# Altium schematic sheet MERLIN_Finger_4x4.SchDoc
size A2; SheetNumber: 1; SheetTotal: 1
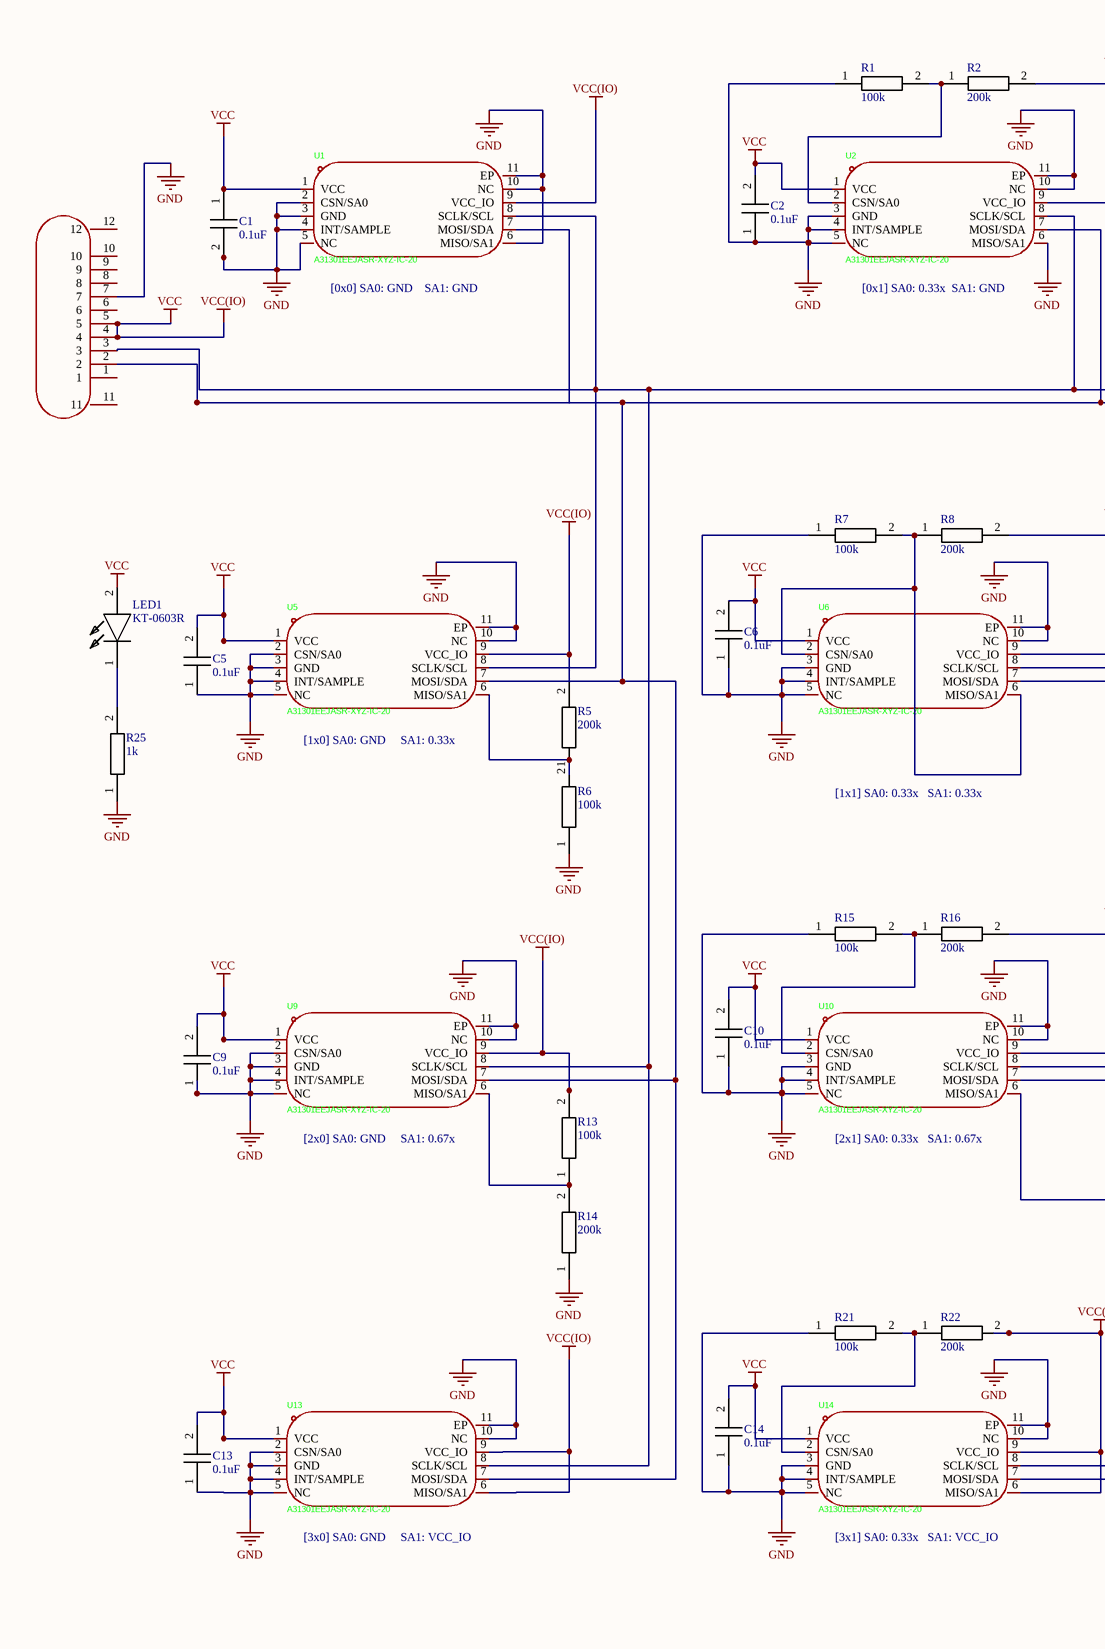
[diagram p0: MERLIN_Finger_4x4.SchDoc, left]
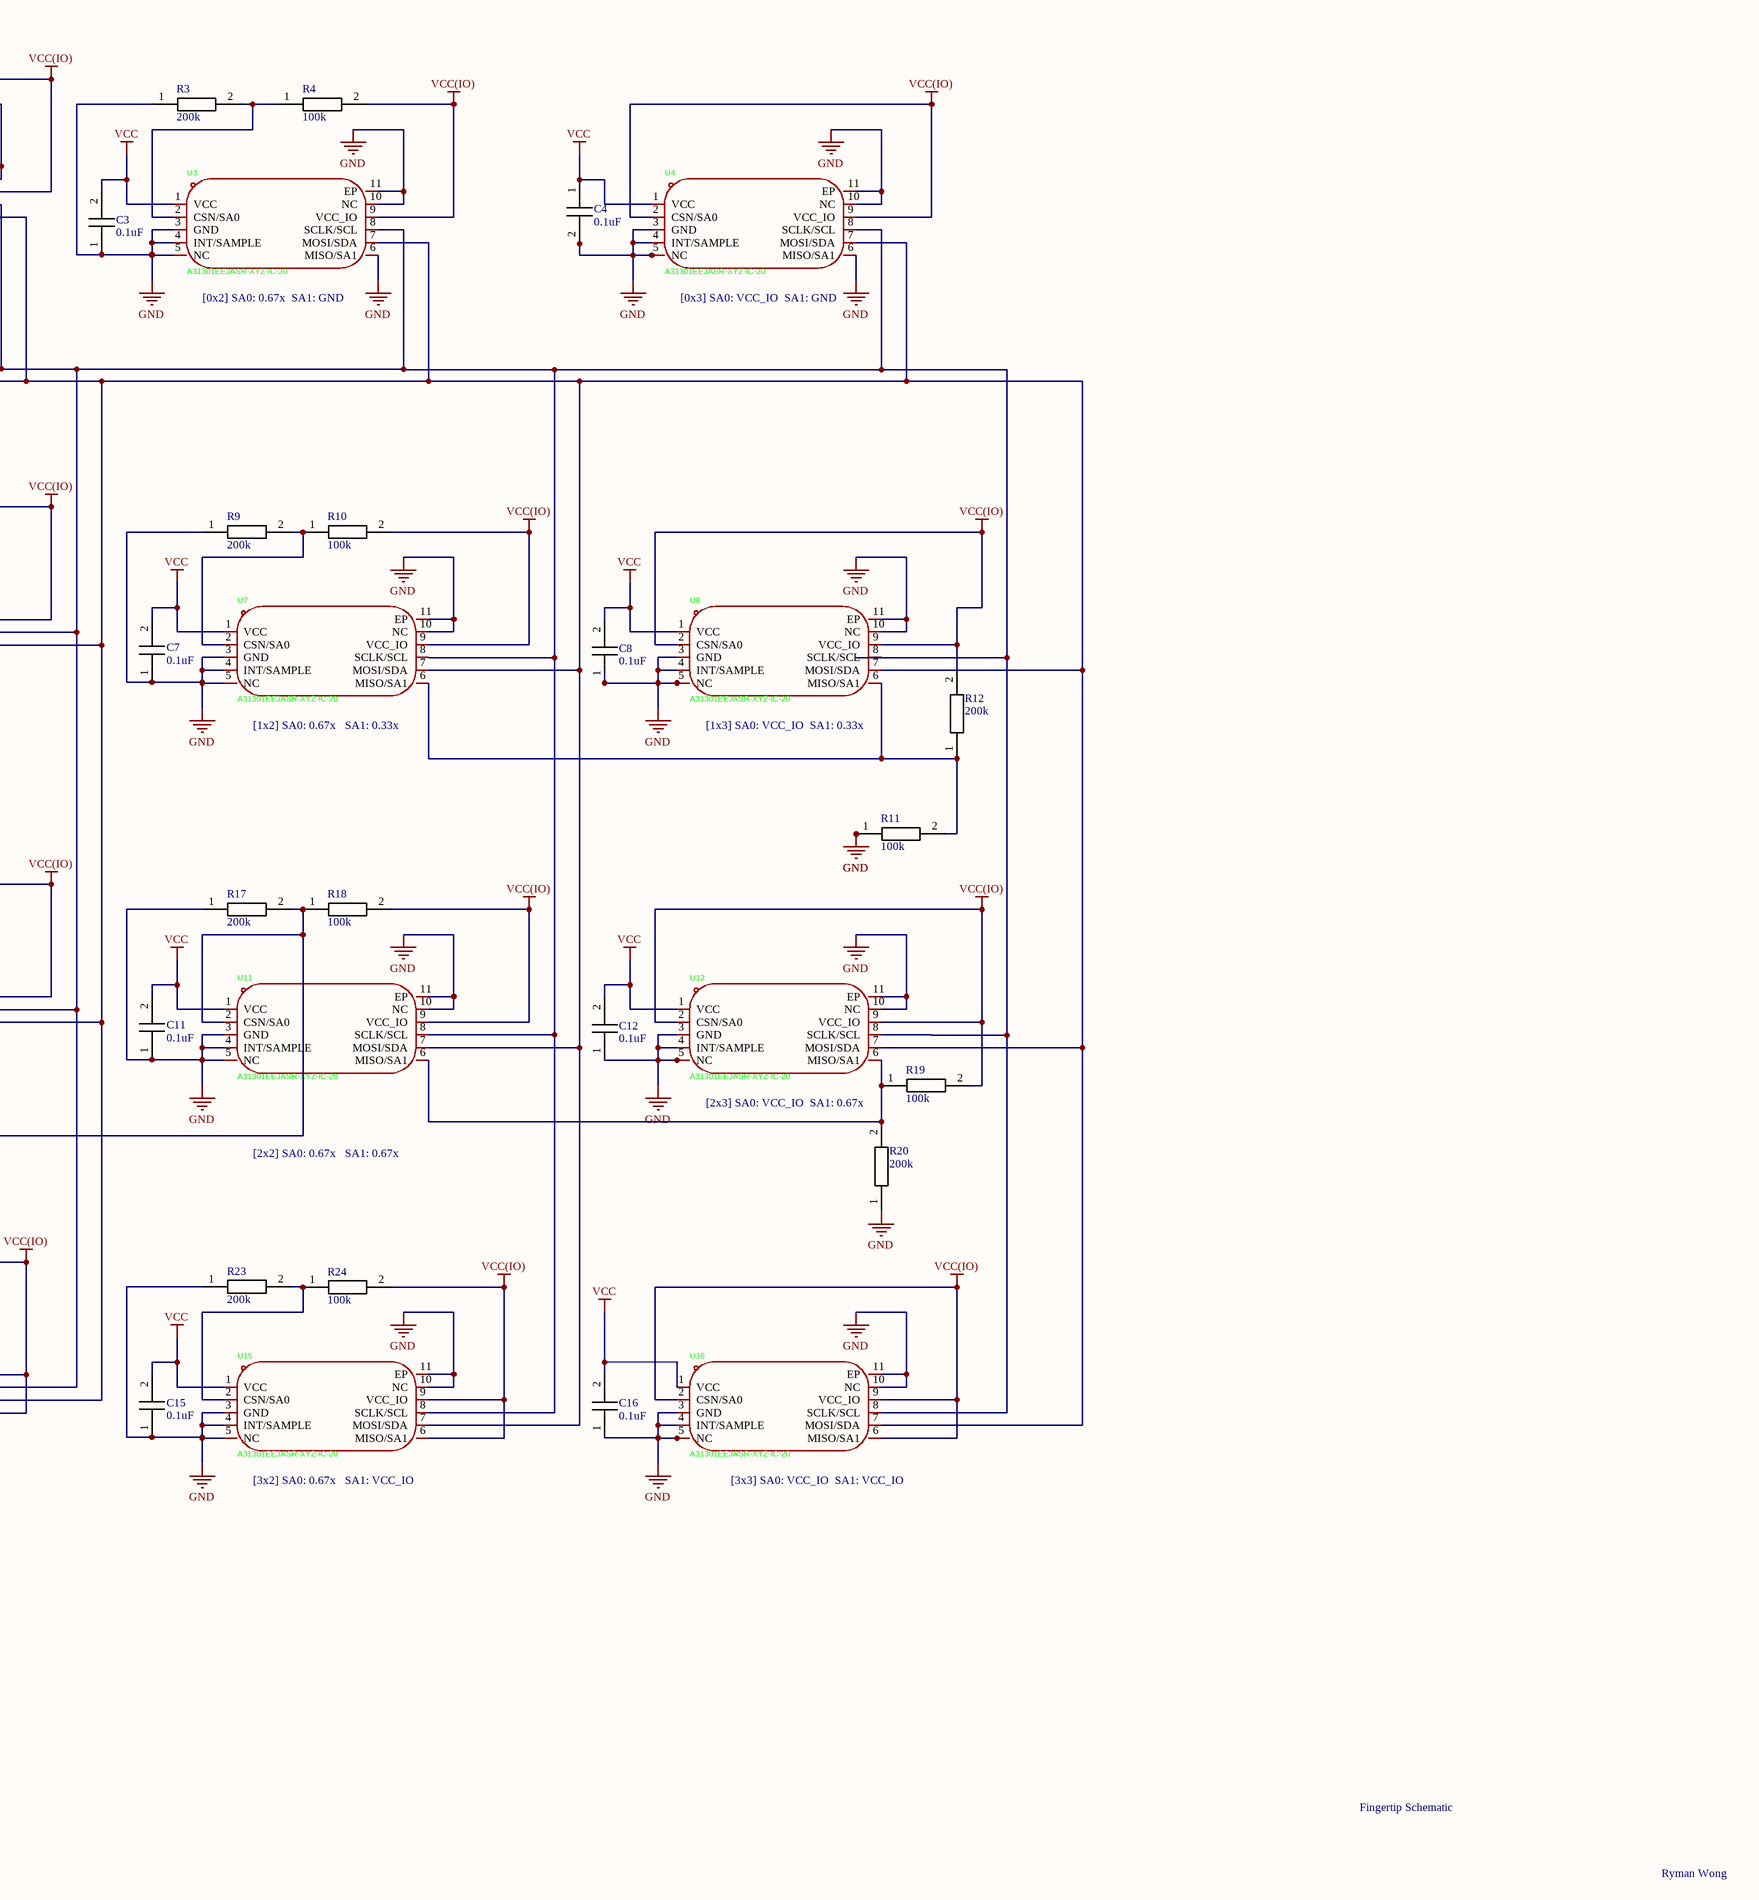
[diagram p1: MERLIN_Finger_4x4.SchDoc, right]

## Parts
C1  0.1uF  [CAPC1608X90N]
C2  0.1uF  [CAPC1608X90N]
C3  0.1uF  [CAPC1608X90N]
C4  0.1uF  [CAPC1608X90N]
C5  0.1uF  [CAPC1608X90N]
C6  0.1uF  [CAPC1608X90N]
C7  0.1uF  [CAPC1608X90N]
C8  0.1uF  [CAPC1608X90N]
C9  0.1uF  [CAPC1608X90N]
C10  0.1uF  [CAPC1608X90N]
C11  0.1uF  [CAPC1608X90N]
C12  0.1uF  [CAPC1608X90N]
C13  0.1uF  [CAPC1608X90N]
C14  0.1uF  [CAPC1608X90N]
C15  0.1uF  [CAPC1608X90N]
C16  0.1uF  [CAPC1608X90N]
FPC1  AFC07-S10ECA-00  [FPC-SMD_P0.50-10P_LCS-SJ-H2.0]  (value not drawn)
LED1  KT-0603R  [LEDC1608X70N]
R1  100k  [0603WAF3300T5E]
R2  200k  [0603WAF3300T5E]
R3  200k  [0603WAF3300T5E]
R4  100k  [0603WAF3300T5E]
R5  200k  [0603WAF3300T5E]
R6  100k  [0603WAF3300T5E]
R7  100k  [0603WAF3300T5E]
R8  200k  [0603WAF3300T5E]
R9  200k  [0603WAF3300T5E]
R10  100k  [0603WAF3300T5E]
R11  100k  [0603WAF3300T5E]
R12  200k  [0603WAF3300T5E]
R13  100k  [0603WAF3300T5E]
R14  200k  [0603WAF3300T5E]
R15  100k  [0603WAF3300T5E]
R16  200k  [0603WAF3300T5E]
R17  200k  [0603WAF3300T5E]
R18  100k  [0603WAF3300T5E]
R19  100k  [0603WAF3300T5E]
R20  200k  [0603WAF3300T5E]
R21  100k  [0603WAF3300T5E]
R22  200k  [0603WAF3300T5E]
R23  200k  [0603WAF3300T5E]
R24  100k  [0603WAF3300T5E]
R25  1k  [0603WAF3300T5E]
U1  A31301EEJASR-XYZ-IC-20  [DFN-10_L3.0-W3.0-P0.50-BL-EP2.4]
U2  A31301EEJASR-XYZ-IC-20  [DFN-10_L3.0-W3.0-P0.50-BL-EP2.4]
U3  A31301EEJASR-XYZ-IC-20  [DFN-10_L3.0-W3.0-P0.50-BL-EP2.4]
U4  A31301EEJASR-XYZ-IC-20  [DFN-10_L3.0-W3.0-P0.50-BL-EP2.4]
U5  A31301EEJASR-XYZ-IC-20  [DFN-10_L3.0-W3.0-P0.50-BL-EP2.4]
U6  A31301EEJASR-XYZ-IC-20  [DFN-10_L3.0-W3.0-P0.50-BL-EP2.4]
U7  A31301EEJASR-XYZ-IC-20  [DFN-10_L3.0-W3.0-P0.50-BL-EP2.4]
U8  A31301EEJASR-XYZ-IC-20  [DFN-10_L3.0-W3.0-P0.50-BL-EP2.4]
U9  A31301EEJASR-XYZ-IC-20  [DFN-10_L3.0-W3.0-P0.50-BL-EP2.4]
U10  A31301EEJASR-XYZ-IC-20  [DFN-10_L3.0-W3.0-P0.50-BL-EP2.4]
U11  A31301EEJASR-XYZ-IC-20  [DFN-10_L3.0-W3.0-P0.50-BL-EP2.4]
U12  A31301EEJASR-XYZ-IC-20  [DFN-10_L3.0-W3.0-P0.50-BL-EP2.4]
U13  A31301EEJASR-XYZ-IC-20  [DFN-10_L3.0-W3.0-P0.50-BL-EP2.4]
U14  A31301EEJASR-XYZ-IC-20  [DFN-10_L3.0-W3.0-P0.50-BL-EP2.4]
U15  A31301EEJASR-XYZ-IC-20  [DFN-10_L3.0-W3.0-P0.50-BL-EP2.4]
U16  A31301EEJASR-XYZ-IC-20  [DFN-10_L3.0-W3.0-P0.50-BL-EP2.4]

## Nets
GND: C1.2 C2.1 C3.1 C4.2 C5.1 C6.1 C7.1 C8.1 C9.1 C10.1 C11.1 C12.1 C13.1 C14.1 C15.1 C16.1 FPC1.7 R1.1 R3.1 R6.1 R7.1 R9.1 R11.1 R14.1 R15.1 R17.1 R20.1 R21.1 R23.1 R25.1 U1.2(CSN/SA0) U1.3(GND) U1.4(INT/SAMPLE) U1.5(NC) U1.6(MISO/SA1) U1.10(NC) U1.11(EP) U2.3(GND) U2.4(INT/SAMPLE) U2.5(NC) U2.6(MISO/SA1) U2.10(NC) U2.11(EP) U3.3(GND) U3.4(INT/SAMPLE) U3.5(NC) U3.6(MISO/SA1) U3.10(NC) U3.11(EP) U4.3(GND) U4.4(INT/SAMPLE) U4.5(NC) U4.6(MISO/SA1) U4.10(NC) U4.11(EP) U5.2(CSN/SA0) U5.3(GND) U5.4(INT/SAMPLE) U5.5(NC) U5.10(NC) U5.11(EP) U6.3(GND) U6.4(INT/SAMPLE) U6.5(NC) U6.10(NC) U6.11(EP) U7.3(GND) U7.4(INT/SAMPLE) U7.5(NC) U7.10(NC) U7.11(EP) U8.3(GND) U8.4(INT/SAMPLE) U8.5(NC) U8.10(NC) U8.11(EP) U9.2(CSN/SA0) U9.3(GND) U9.4(INT/SAMPLE) U9.5(NC) U9.10(NC) U9.11(EP) U10.3(GND) U10.4(INT/SAMPLE) U10.5(NC) U10.10(NC) U10.11(EP) U11.3(GND) U11.4(INT/SAMPLE) U11.5(NC) U11.10(NC) U11.11(EP) U12.3(GND) U12.4(INT/SAMPLE) U12.5(NC) U12.10(NC) U12.11(EP) U13.2(CSN/SA0) U13.3(GND) U13.4(INT/SAMPLE) U13.5(NC) U13.10(NC) U13.11(EP) U14.3(GND) U14.4(INT/SAMPLE) U14.5(NC) U14.10(NC) U14.11(EP) U15.3(GND) U15.4(INT/SAMPLE) U15.5(NC) U15.10(NC) U15.11(EP) U16.3(GND) U16.4(INT/SAMPLE) U16.5(NC) U16.10(NC) U16.11(EP)
VCC: C1.1 C2.2 C3.2 C4.1 C5.2 C6.2 C7.2 C8.2 C9.2 C10.2 C11.2 C12.2 C13.2 C14.2 C15.2 C16.2 FPC1.4 FPC1.5 LED1.2(A) R2.2 R4.2 R5.2 R8.2 R10.2 R12.2 R13.2 R16.2 R18.2 R19.2 R22.2 R24.2 U1.1(VCC) U1.9(VCC_IO) U2.1(VCC) U2.9(VCC_IO) U3.1(VCC) U3.9(VCC_IO) U4.1(VCC) U4.2(CSN/SA0) U4.9(VCC_IO) U5.1(VCC) U5.9(VCC_IO) U6.1(VCC) U6.9(VCC_IO) U7.1(VCC) U7.9(VCC_IO) U8.1(VCC) U8.2(CSN/SA0) U8.9(VCC_IO) U9.1(VCC) U9.9(VCC_IO) U10.1(VCC) U10.9(VCC_IO) U11.1(VCC) U11.9(VCC_IO) U12.1(VCC) U12.2(CSN/SA0) U12.9(VCC_IO) U13.1(VCC) U13.6(MISO/SA1) U13.9(VCC_IO) U14.1(VCC) U14.6(MISO/SA1) U14.9(VCC_IO) U15.1(VCC) U15.6(MISO/SA1) U15.9(VCC_IO) U16.1(VCC) U16.2(CSN/SA0) U16.6(MISO/SA1) U16.9(VCC_IO)  [also labelled VCC(IO)]
NetFPC1_2: FPC1.2 U1.7(MOSI/SDA) U2.7(MOSI/SDA) U3.7(MOSI/SDA) U4.7(MOSI/SDA) U5.7(MOSI/SDA) U6.7(MOSI/SDA) U7.7(MOSI/SDA) U8.7(MOSI/SDA) U9.7(MOSI/SDA) U10.7(MOSI/SDA) U11.7(MOSI/SDA) U12.7(MOSI/SDA) U13.7(MOSI/SDA) U14.7(MOSI/SDA) U15.7(MOSI/SDA) U16.7(MOSI/SDA)
NetFPC1_3: FPC1.3 U1.8(SCLK/SCL) U2.8(SCLK/SCL) U3.8(SCLK/SCL) U4.8(SCLK/SCL) U5.8(SCLK/SCL) U6.8(SCLK/SCL) U7.8(SCLK/SCL) U8.8(SCLK/SCL) U9.8(SCLK/SCL) U10.8(SCLK/SCL) U11.8(SCLK/SCL) U12.8(SCLK/SCL) U13.8(SCLK/SCL) U14.8(SCLK/SCL) U15.8(SCLK/SCL) U16.8(SCLK/SCL)
NetLED1_1: LED1.1(K) R25.2
NetR1_2: R1.2 R2.1 U2.2(CSN/SA0)
NetR3_2: R3.2 R4.1 U3.2(CSN/SA0)
NetR5_1: R5.1 R6.2 U5.6(MISO/SA1)
NetR7_2: R7.2 R8.1 U6.2(CSN/SA0) U6.6(MISO/SA1)
NetR9_2: R9.2 R10.1 U7.2(CSN/SA0)
NetR11_2: R11.2 R12.1 U7.6(MISO/SA1) U8.6(MISO/SA1)
NetR13_1: R13.1 R14.2 U9.6(MISO/SA1)
NetR15_2: R15.2 R16.1 U10.2(CSN/SA0)
NetR17_2: R17.2 R18.1 U10.6(MISO/SA1) U11.2(CSN/SA0)
NetR19_1: R19.1 R20.2 U11.6(MISO/SA1) U12.6(MISO/SA1)
NetR21_2: R21.2 R22.1 U14.2(CSN/SA0)
NetR23_2: R23.2 R24.1 U15.2(CSN/SA0)

Not connected (* = marked no-connect by the designer): FPC1 1 6 8 9 10 11 12

## Notes on the sheet
- (near U1) [0x0] SA0: GND    SA1: GND
- (near U2) [0x1] SA0: 0.33x  SA1: GND
- (near U3) [0x2] SA0: 0.67x  SA1: GND
- (near U4) [0x3] SA0: VCC_IO  SA1: GND
- (near U5) [1x0] SA0: GND     SA1: 0.33x
- (near U7) [1x2] SA0: 0.67x   SA1: 0.33x
- (near U8) [1x3] SA0: VCC_IO  SA1: 0.33x
- [1x1] SA0: 0.33x   SA1: 0.33x
- (near U9) [2x0] SA0: GND     SA1: 0.67x
- (near U10) [2x1] SA0: 0.33x   SA1: 0.67x
- [2x3] SA0: VCC_IO  SA1: 0.67x
- [2x2] SA0: 0.67x   SA1: 0.67x
- (near U13) [3x0] SA0: GND     SA1: VCC_IO
- (near U14) [3x1] SA0: 0.33x   SA1: VCC_IO
- (near U15) [3x2] SA0: 0.67x   SA1: VCC_IO
- (near U16) [3x3] SA0: VCC_IO  SA1: VCC_IO
- Fingertip Schematic
- Ryman Wong

## Library data of the parts
C1-C16 = CC0603KRX7R9BB104: Capacitor; Manufacturer_Name: Yageo Group; Datasheet Link: https://www.digikey.com/en/products/detail/yageo/CC0603KRX7R9BB104/2103082; Height: 0.9mm; Manufacturer_Part_Number: CC0603KRX7R9BB104; Mouser Part Number: 603-CC603KRX7R9BB104; Mouser Price/Stock: https://www.mouser.co.uk/ProductDetail/YAGEO/CC0603KRX7R9BB104?qs=vTakOoo5QyLvVCYM2ge8LQ%3D%3D; Arrow Part Number: CC0603KRX7R9BB104; Arrow Price/Stock: https://www.arrow.com/en/products/cc0603krx7r9bb104/yageo?utm_currency=USD&region=europe
FPC1 = AFC07-S10ECA-00: Manufacturer: JS(钜硕电子); Add into BOM: yes; Locking Feature: Slide Lock; Number of Contacts: 10P; Pitch: 0.5mm; FFC, FCB Thickness: 0.3mm; Symbol: AFC07-S10ECA-00; Device: AFC07-S10ECA-00; LCSC Part Name: 抽屉式 上接 P数:10P 间距:0.5mm; Supplier Part: C262583; Manufacturer Part: AFC07-S10ECA-00; Supplier Footprint: SMD,P=0.5mm,卧贴; JLCPCB Part Class: Extended Part; Datasheet: https://item.szlcsc.com/datasheet/AFC07-S10ECA-00/253892.html; Supplier: LCSC; Convert to PCB: yes; Contact Type: Top Contact; Mounting Type: Surface Mount, Right Angle; Height Above Board: 2mm; Contact Material: Copper Alloy; Contact Plating: Tin
LED1 = KT-0603R: LED; Manufacturer_Name: Hubei KENTO Elec; Datasheet Link: https://datasheet.lcsc.com/szlcsc/Hubei-KENTO-Elec-KT-0603R_C2286.pdf; Height: 0.7mm; Manufacturer_Part_Number: KT-0603R
R1-R25 = 0603WAF3300T5E: Resistor; Manufacturer_Name: ROYALOHM; Datasheet Link: https://www.mouser.com/datasheet/3/5925/1/1.pdf; Height: 0.55mm; Manufacturer_Part_Number: 0603WAF3300T5E; Mouser Part Number: 303-0603WAF3300T5E; Mouser Price/Stock: https://www.mouser.co.uk/ProductDetail/Royalohm/0603WAF3300T5E?qs=e8oIoAS2J1TtsqbFqPpAVg%3D%3D
U1-U16 = CMP-006-000000-2: Manufacturer: ALLEGRO(?????); Voltage - Supply: 2.65V~3.6V; Convert to PCB: yes; Current - Supply: 3.8mA; Magnetic Sensing Range(Z): ±200mT; Interface Type: I2C; Output bit: 15bit; Design Item ID: A31301EEJASR-XYZ-IC-20; Source: A31301EEJASR-XYZ-IC-201_A31301EEJASR-XYZ-IC-20.SCHLIB; Datasheet: https://item.szlcsc.com/datasheet/A31301EEJASR-XYZ-IC-20/24162961.html; Manufacturer Part: A31301EEJASR-XYZ-IC-20; Operating Temperature: -40?~+85?; Supplier Footprint: DFN-10-EP(3x3); Symbol: A31301EEJASR-XYZ-IC-20; Add into BOM: yes; Supplier Part: C22465894; JLCPCB Part Class: Extended Part; LCSC Part Name: ??SPI?I2C?????????????3D?????????; Device: A31301EEJASR-XYZ-IC-20; Component Type: Standard; Magnetic Sensing Range(X,Y): ±200mT; Pin Count: 11